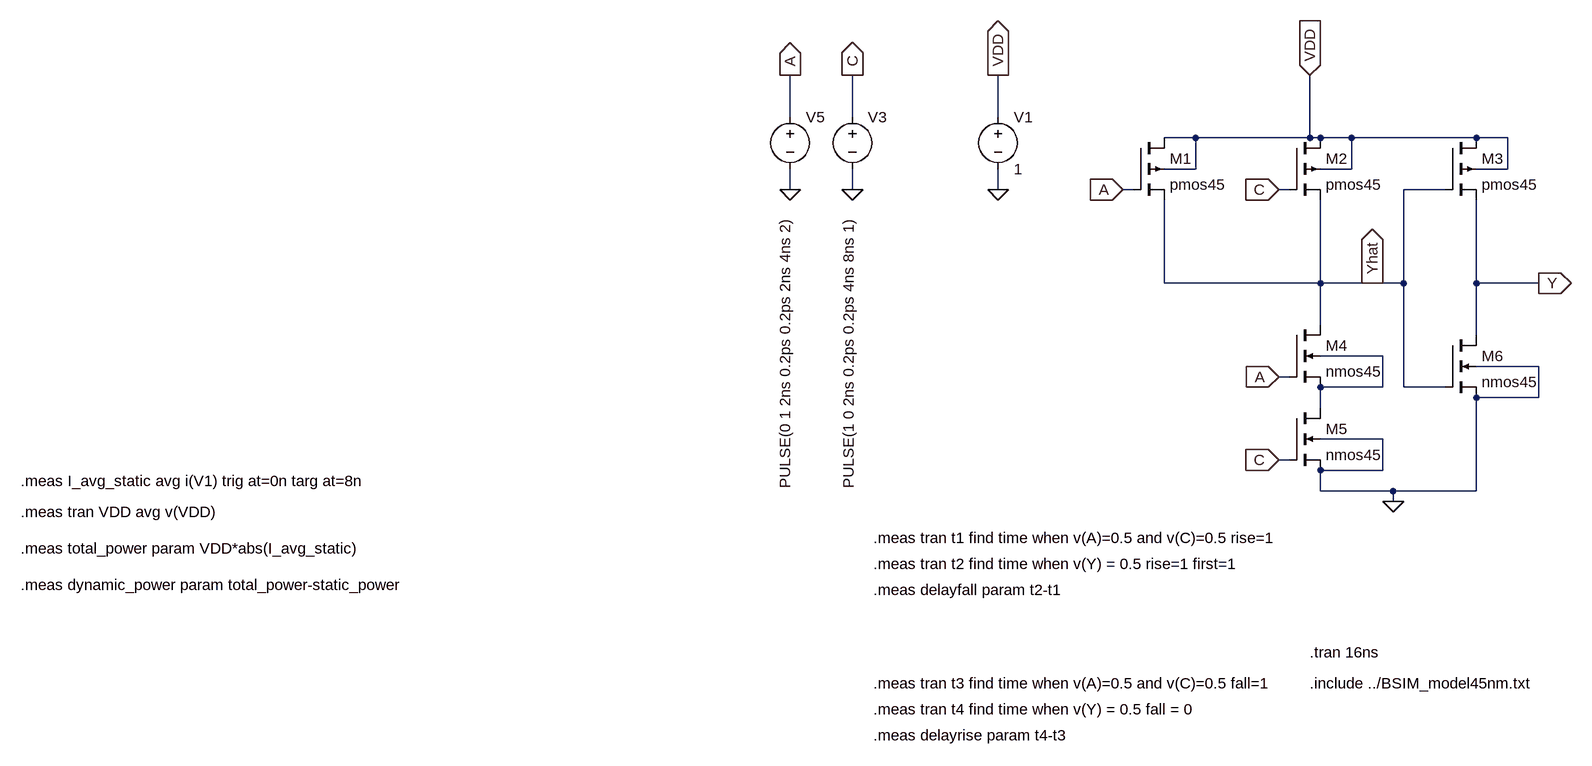
[diagram p0: schematic Kredsloeb eksamen 2023.asc]
Kredsloeb eksamen 2023.asc, the LTspice schematic file:
Version 4
SHEET 1 880 1344
WIRE -512 48 -512 -16
WIRE -416 48 -416 -16
WIRE -192 48 -192 -16
WIRE 112 80 64 80
WIRE 288 80 288 -16
WIRE 288 80 112 80
WIRE 304 80 288 80
WIRE 352 80 304 80
WIRE 544 80 352 80
WIRE 592 80 544 80
WIRE 112 128 112 80
WIRE 112 128 64 128
WIRE 352 128 352 80
WIRE 352 128 304 128
WIRE 592 128 592 80
WIRE 592 128 544 128
WIRE -512 160 -512 128
WIRE -416 160 -416 128
WIRE -192 160 -192 128
WIRE 16 160 0 160
WIRE 256 160 240 160
WIRE 496 160 432 160
WIRE 64 304 64 176
WIRE 304 304 304 176
WIRE 304 304 64 304
WIRE 384 304 304 304
WIRE 432 304 432 160
WIRE 432 304 384 304
WIRE 544 304 544 176
WIRE 640 304 544 304
WIRE 304 368 304 304
WIRE 544 384 544 304
WIRE 400 416 304 416
WIRE 640 432 544 432
WIRE 256 448 240 448
WIRE 400 464 400 416
WIRE 400 464 304 464
WIRE 432 464 432 304
WIRE 496 464 432 464
WIRE 640 480 640 432
WIRE 640 480 544 480
WIRE 304 496 304 464
WIRE 400 544 304 544
WIRE 256 576 240 576
WIRE 400 592 400 544
WIRE 400 592 304 592
WIRE 304 624 304 592
WIRE 416 624 304 624
WIRE 544 624 544 480
WIRE 544 624 416 624
WIRE 416 640 416 624
FLAG 288 -16 VDD
IOPIN 288 -16 In
FLAG -192 160 0
FLAG -192 -16 VDD
IOPIN -192 -16 Out
FLAG -416 160 0
FLAG -416 -16 C
IOPIN -416 -16 Out
FLAG -512 160 0
FLAG -512 -16 A
IOPIN -512 -16 Out
FLAG 0 160 A
IOPIN 0 160 In
FLAG 240 160 C
IOPIN 240 160 In
FLAG 240 448 A
IOPIN 240 448 In
FLAG 240 576 C
IOPIN 240 576 In
FLAG 640 304 Y
IOPIN 640 304 Out
FLAG 416 640 0
FLAG 384 304 Yhat
IOPIN 384 304 Out
SYMBOL Voltage -192 32 R0
SYMATTR InstName V1
SYMATTR Value 1
SYMBOL Voltage -416 32 R0
WINDOW 3 -6 588 VLeft 2
SYMATTR Value PULSE(1 0 2ns 0.2ps 0.2ps 4ns 8ns 1)
SYMATTR InstName V3
SYMBOL Voltage -512 32 R0
WINDOW 3 -8 588 VLeft 2
SYMATTR Value PULSE(0 1 2ns 0.2ps 0.2ps 2ns 4ns 2)
SYMATTR InstName V5
SYMBOL pmos4 16 80 R0
SYMATTR InstName M1
SYMATTR Value pmos45
SYMATTR Value2 l=60nm w=400nm
SYMBOL pmos4 256 80 R0
SYMATTR InstName M2
SYMATTR Value pmos45
SYMATTR Value2 l=60nm w=400nm
SYMBOL pmos4 496 80 R0
SYMATTR InstName M3
SYMATTR Value pmos45
SYMATTR Value2 l=60nm w=400nm
SYMBOL nmos4 256 368 R0
SYMATTR InstName M4
SYMATTR Value nmos45
SYMATTR Value2 l=60nm w=400nm
SYMBOL nmos4 256 496 R0
SYMATTR InstName M5
SYMATTR Value nmos45
SYMATTR Value2 l=60nm w=400nm
SYMBOL nmos4 496 384 R0
SYMATTR InstName M6
SYMATTR Value nmos45
SYMATTR Value2 l=60nm w=400nm
TEXT 288 872 Left 2 !.tran 16ns
TEXT 288 920 Left 2 !.include ../BSIM_model45nm.txt
TEXT -384 696 Left 2 !.meas tran t1 find time when v(A)=0.5 and v(C)=0.5 rise=1
TEXT -384 736 Left 2 !.meas tran t2 find time when v(Y) = 0.5 rise=1 first=1
TEXT -384 776 Left 2 !.meas delayfall param t2-t1
TEXT -384 920 Left 2 !.meas tran t3 find time when v(A)=0.5 and v(C)=0.5 fall=1
TEXT -384 960 Left 2 !.meas tran t4 find time when v(Y) = 0.5 fall = 0
TEXT -384 1000 Left 2 !.meas delayrise param t4-t3
TEXT -1696 608 Left 2 !.meas I_avg_static avg i(V1) trig at=0n targ at=8n
TEXT -1696 656 Left 2 !.meas tran VDD avg v(VDD)
TEXT -1696 712 Left 2 !.meas total_power param VDD*abs(I_avg_static)
TEXT -1696 768 Left 2 !.meas dynamic_power param total_power-static_power

The netlist it stands for:
* Kredsloeb eksamen 2023.asc
V1 VDD 0 1
V3 C 0 PULSE(1 0 2ns 0.2ps 0.2ps 4ns 8ns 1)
V5 A 0 PULSE(0 1 2ns 0.2ps 0.2ps 2ns 4ns 2)
M1 VDD A Yhat VDD pmos45 l=60nm w=400nm
M2 VDD C Yhat VDD pmos45 l=60nm w=400nm
M3 VDD Yhat Y VDD pmos45 l=60nm w=400nm
M4 Yhat A N001 N001 nmos45 l=60nm w=400nm
M5 N001 C 0 0 nmos45 l=60nm w=400nm
M6 Y Yhat 0 0 nmos45 l=60nm w=400nm
.model NMOS NMOS
.model PMOS PMOS
.lib standard.mos
.tran 16ns
.include ../BSIM_model45nm.txt
.meas tran t1 find time when v(A)=0.5 and v(C)=0.5 rise=1
.meas tran t2 find time when v(Y) = 0.5 rise=1 first=1
.meas delayfall param t2-t1
.meas tran t3 find time when v(A)=0.5 and v(C)=0.5 fall=1
.meas tran t4 find time when v(Y) = 0.5 fall = 0
.meas delayrise param t4-t3
.meas I_avg_static avg i(V1) trig at=0n targ at=8n
.meas tran VDD avg v(VDD)
.meas total_power param VDD*abs(I_avg_static)
.meas dynamic_power param total_power-static_power
.backanno
.end